# Altium schematic sheet Power.SchDoc
size A2
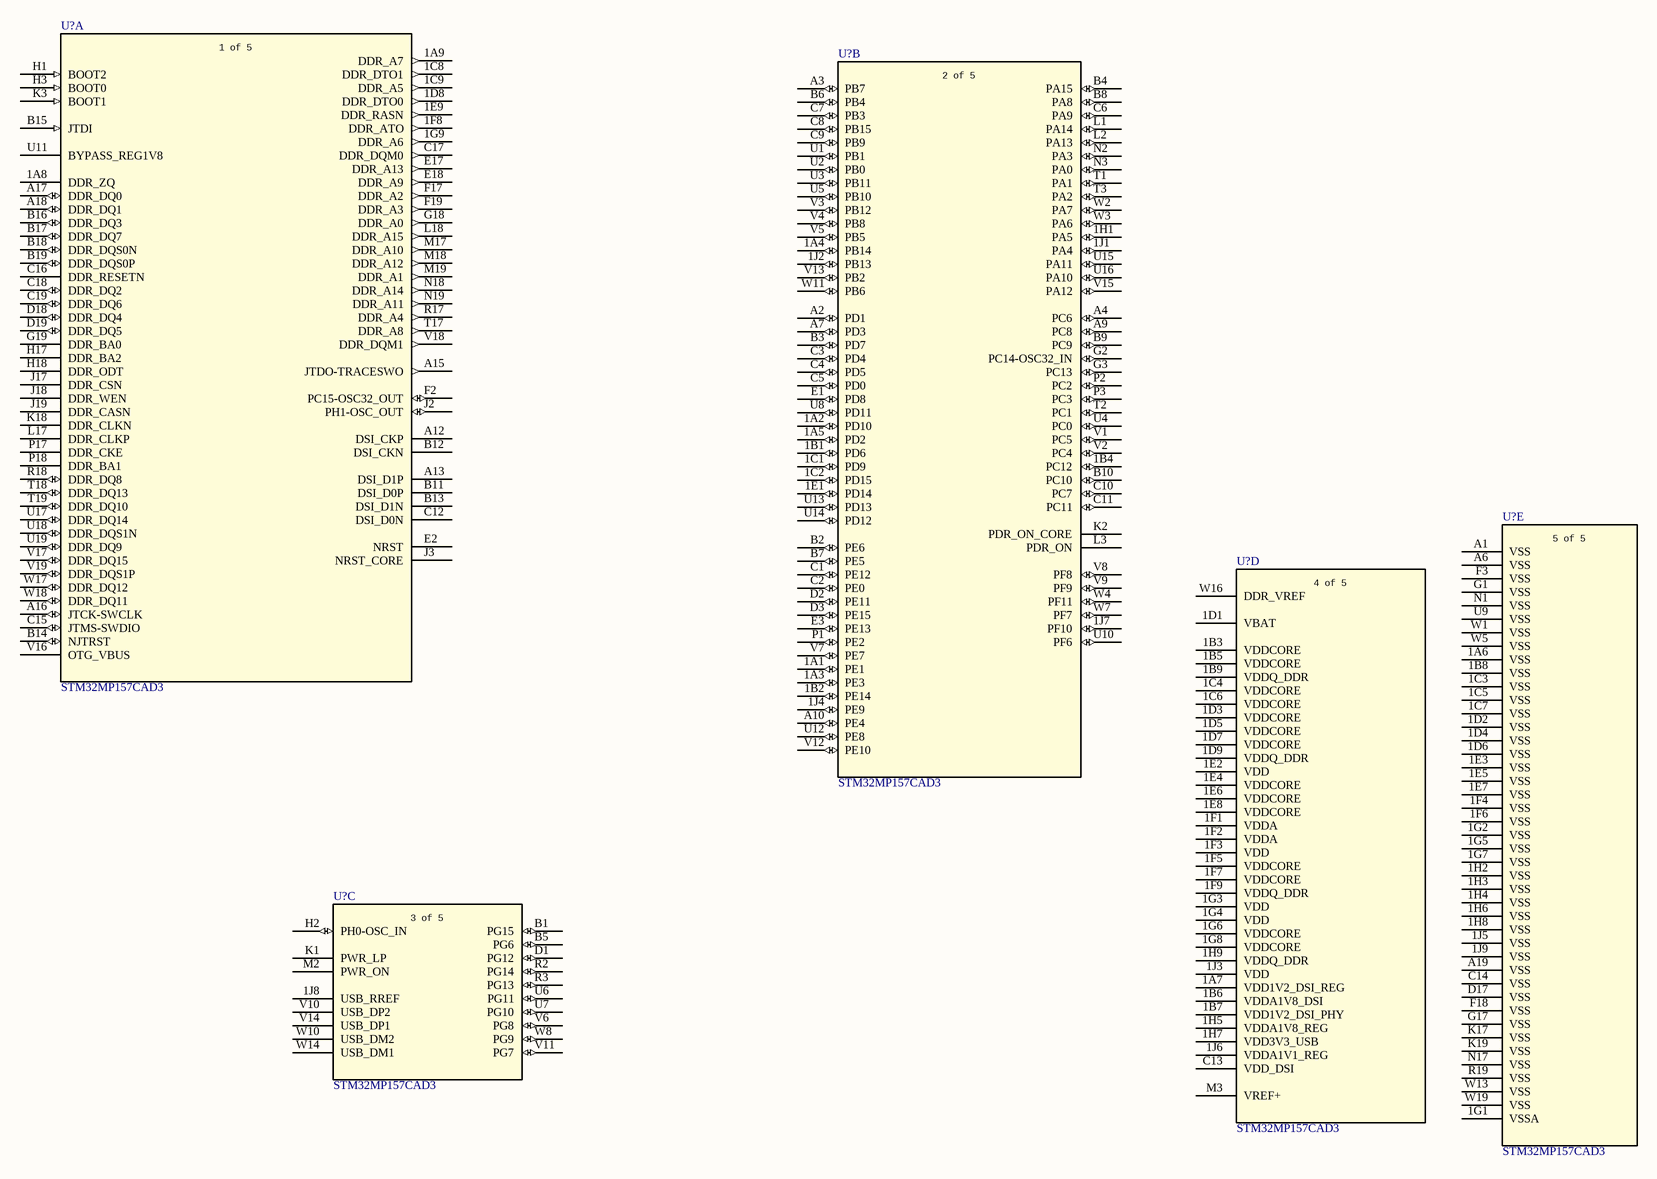
[diagram p0: Power.SchDoc]

## Parts
(Parts that share a designator on the sheet are numbered #1, #2 ... from top to bottom, then left to right.)
U?#1  STM32MP157CAD3  [TFBGA257_10X10]  (part A of 5)
U?#2  STM32MP157CAD3  [TFBGA257_10X10]  (part B of 5)
U?#3  STM32MP157CAD3  [TFBGA257_10X10]  (part E of 5)
U?#4  STM32MP157CAD3  [TFBGA257_10X10]  (part D of 5)
U?#5  STM32MP157CAD3  [TFBGA257_10X10]  (part C of 5)

## Nets

Not connected (* = marked no-connect by the designer): U?#1 1A8(DDR_ZQ) 1A9(DDR_A7) 1C8(DDR_DTO1) 1C9(DDR_A5) 1D8(DDR_DTO0) 1E9(DDR_RASN) 1F8(DDR_ATO) 1G9(DDR_A6) A12(DSI_CKP) A13(DSI_D1P) A15(JTDO-TRACESWO) A16(JTCK-SWCLK) A17(DDR_DQ0) A18(DDR_DQ1) B11(DSI_D0P) B12(DSI_CKN) B13(DSI_D1N) B14(NJTRST) B15(JTDI) B16(DDR_DQ3) B17(DDR_DQ7) B18(DDR_DQS0N) B19(DDR_DQS0P) C12(DSI_D0N) C15(JTMS-SWDIO) C16(DDR_RESETN) C17(DDR_DQM0) C18(DDR_DQ2) C19(DDR_DQ6) D18(DDR_DQ4) D19(DDR_DQ5) E2(NRST) E17(DDR_A13) E18(DDR_A9) F2(PC15-OSC32_OUT) F17(DDR_A2) F19(DDR_A3) G18(DDR_A0) G19(DDR_BA0) H1(BOOT2) H3(BOOT0) H17(DDR_BA2) H18(DDR_ODT) J2(PH1-OSC_OUT) J3(NRST_CORE) J17(DDR_CSN) J18(DDR_WEN) J19(DDR_CASN) K3(BOOT1) K18(DDR_CLKN) L17(DDR_CLKP) L18(DDR_A15) M17(DDR_A10) M18(DDR_A12) M19(DDR_A1) N18(DDR_A14) N19(DDR_A11) P17(DDR_CKE) P18(DDR_BA1) R17(DDR_A4) R18(DDR_DQ8) T17(DDR_A8) T18(DDR_DQ13) T19(DDR_DQ10) U11(BYPASS_REG1V8) U17(DDR_DQ14) U18(DDR_DQS1N) U19(DDR_DQ9) V16(OTG_VBUS) V17(DDR_DQ15) V18(DDR_DQM1) V19(DDR_DQS1P) W17(DDR_DQ12) W18(DDR_DQ11); U?#2 1A1(PE1) 1A2(PD10) 1A3(PE3) 1A4(PB14) 1A5(PD2) 1B1(PD6) 1B2(PE14) 1B4(PC12) 1C1(PD9) 1C2(PD15) 1E1(PD14) 1H1(PA5) 1J1(PA4) 1J2(PB13) 1J4(PE9) 1J7(PF10) A2(PD1) A3(PB7) A4(PC6) A7(PD3) A9(PC8) A10(PE4) B2(PE6) B3(PD7) B4(PA15) B6(PB4) B7(PE5) B8(PA8) B9(PC9) B10(PC10) C1(PE12) C2(PE0) C3(PD4) C4(PD5) C5(PD0) C6(PA9) C7(PB3) C8(PB15) C9(PB9) C10(PC7) C11(PC11) D2(PE11) D3(PE15) E1(PD8) E3(PE13) G2(PC14-OSC32_IN) G3(PC13) K2(PDR_ON_CORE) L1(PA14) L2(PA13) L3(PDR_ON) N2(PA3) N3(PA0) P1(PE2) P2(PC2) P3(PC3) T1(PA1) T2(PC1) T3(PA2) U1(PB1) U2(PB0) U3(PB11) U4(PC0) U5(PB10) U8(PD11) U10(PF6) U12(PE8) U13(PD13) U14(PD12) U15(PA11) U16(PA10) V1(PC5) V2(PC4) V3(PB12) V4(PB8) V5(PB5) V7(PE7) V8(PF8) V9(PF9) V12(PE10) V13(PB2) V15(PA12) W2(PA7) W3(PA6) W4(PF11) W7(PF7) W11(PB6); U?#3 1A6(VSS) 1B8(VSS) 1C3(VSS) 1C5(VSS) 1C7(VSS) 1D2(VSS) 1D4(VSS) 1D6(VSS) 1E3(VSS) 1E5(VSS) 1E7(VSS) 1F4(VSS) 1F6(VSS) 1G1(VSSA) 1G2(VSS) 1G5(VSS) 1G7(VSS) 1H2(VSS) 1H3(VSS) 1H4(VSS) 1H6(VSS) 1H8(VSS) 1J5(VSS) 1J9(VSS) A1(VSS) A6(VSS) A19(VSS) C14(VSS) D17(VSS) F3(VSS) F18(VSS) G1(VSS) G17(VSS) K17(VSS) K19(VSS) N1(VSS) N17(VSS) R19(VSS) U9(VSS) W1(VSS) W5(VSS) W13(VSS) W19(VSS); U?#4 1A7(VDD1V2_DSI_REG) 1B3(VDDCORE) 1B5(VDDCORE) 1B6(VDDA1V8_DSI) 1B7(VDD1V2_DSI_PHY) 1B9(VDDQ_DDR) 1C4(VDDCORE) 1C6(VDDCORE) 1D1(VBAT) 1D3(VDDCORE) 1D5(VDDCORE) 1D7(VDDCORE) 1D9(VDDQ_DDR) 1E2(VDD) 1E4(VDDCORE) 1E6(VDDCORE) 1E8(VDDCORE) 1F1(VDDA) 1F2(VDDA) 1F3(VDD) 1F5(VDDCORE) 1F7(VDDCORE) 1F9(VDDQ_DDR) 1G3(VDD) 1G4(VDD) 1G6(VDDCORE) 1G8(VDDCORE) 1H5(VDDA1V8_REG) 1H7(VDD3V3_USB) 1H9(VDDQ_DDR) 1J3(VDD) 1J6(VDDA1V1_REG) C13(VDD_DSI) M3(VREF+) W16(DDR_VREF); U?#5 1J8(USB_RREF) B1(PG15) B5(PG6) D1(PG12) H2(PH0-OSC_IN) K1(PWR_LP) M2(PWR_ON) R2(PG14) R3(PG13) U6(PG11) U7(PG10) V6(PG8) V10(USB_DP2) V11(PG7) V14(USB_DP1) W8(PG9) W10(USB_DM2) W14(USB_DM1)

## Notes on the sheet
- (in symbol STM32MP157CAD3, part A) 1 of 5
- (in symbol STM32MP157CAD3, part B) 2 of 5
- (in symbol STM32MP157CAD3, part C) 3 of 5
- (in symbol STM32MP157CAD3, part D) 4 of 5
- (in symbol STM32MP157CAD3, part E) 5 of 5

## Library data of the parts
U?#1-U?#5 = STM32MP157CAD3: No Description Available; Mfr_Name: STMicroelectronics; Copyright: Copyright (C) 2022 Ultra Librarian. All rights reserved.; Manufacturer_Part_Number: STM32MP157CAD3; RefDes: RefDes; Type: DEV